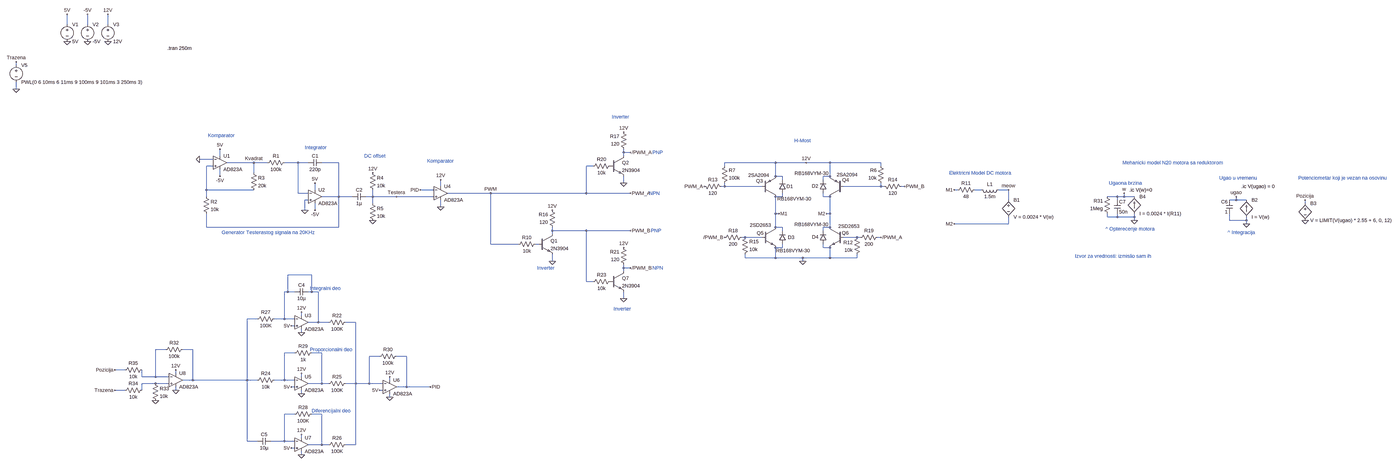
[diagram p0: schematic OP-AMP-OSC-Logicki.asc, whole sheet]
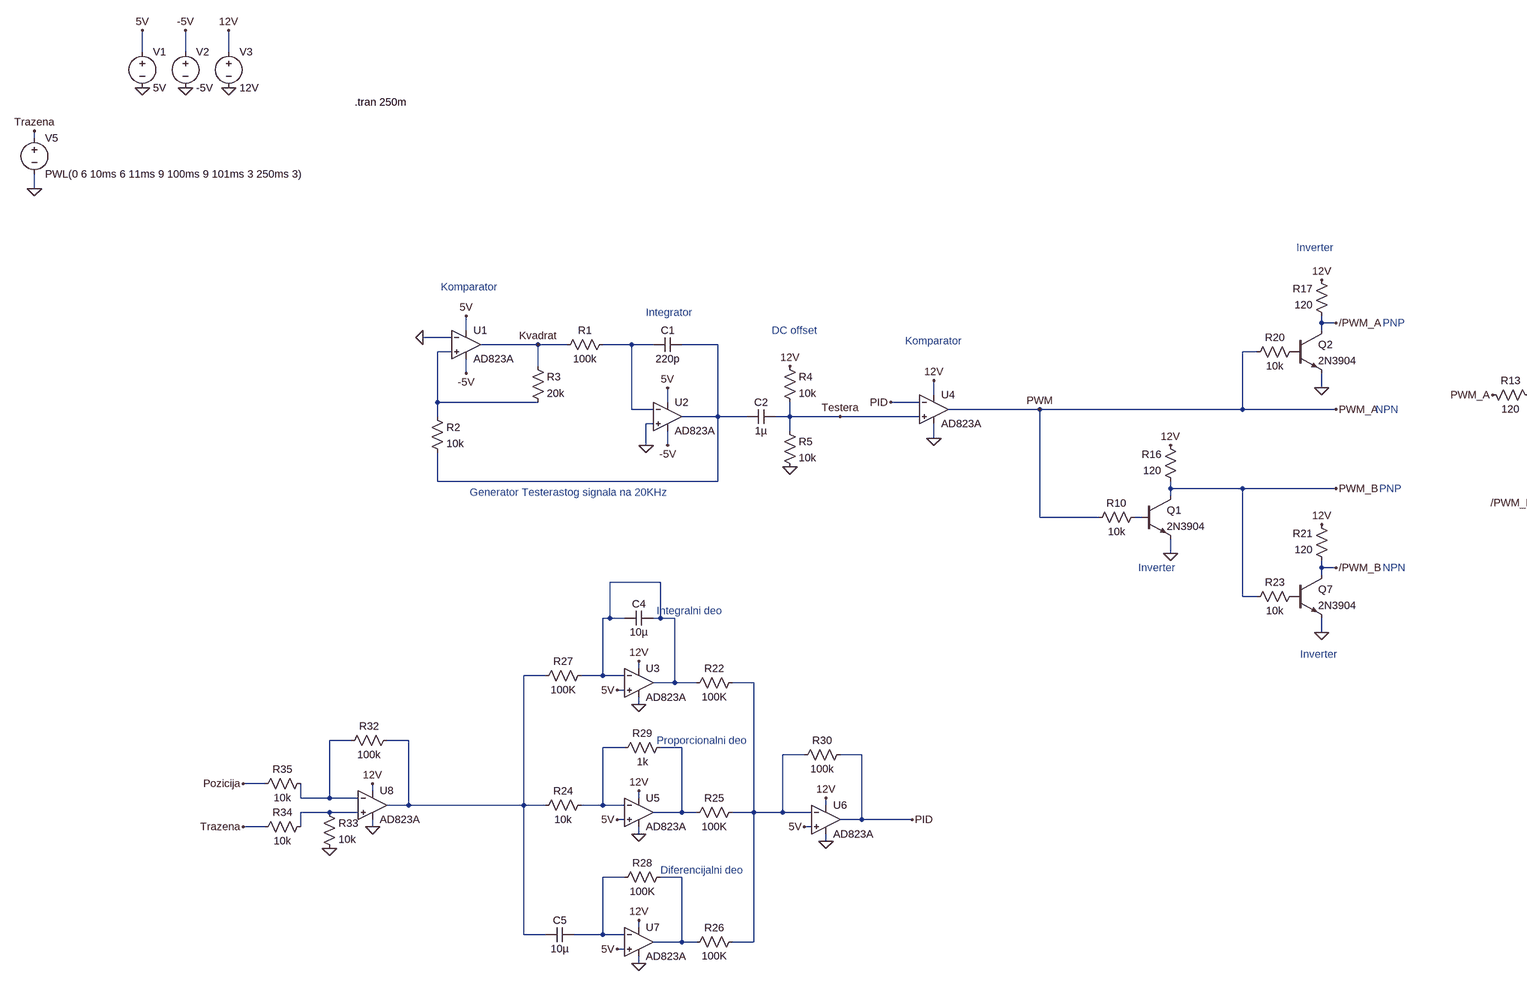
[diagram p1: schematic OP-AMP-OSC-Logicki.asc, part, row 1 of 1, column 1 of 2]
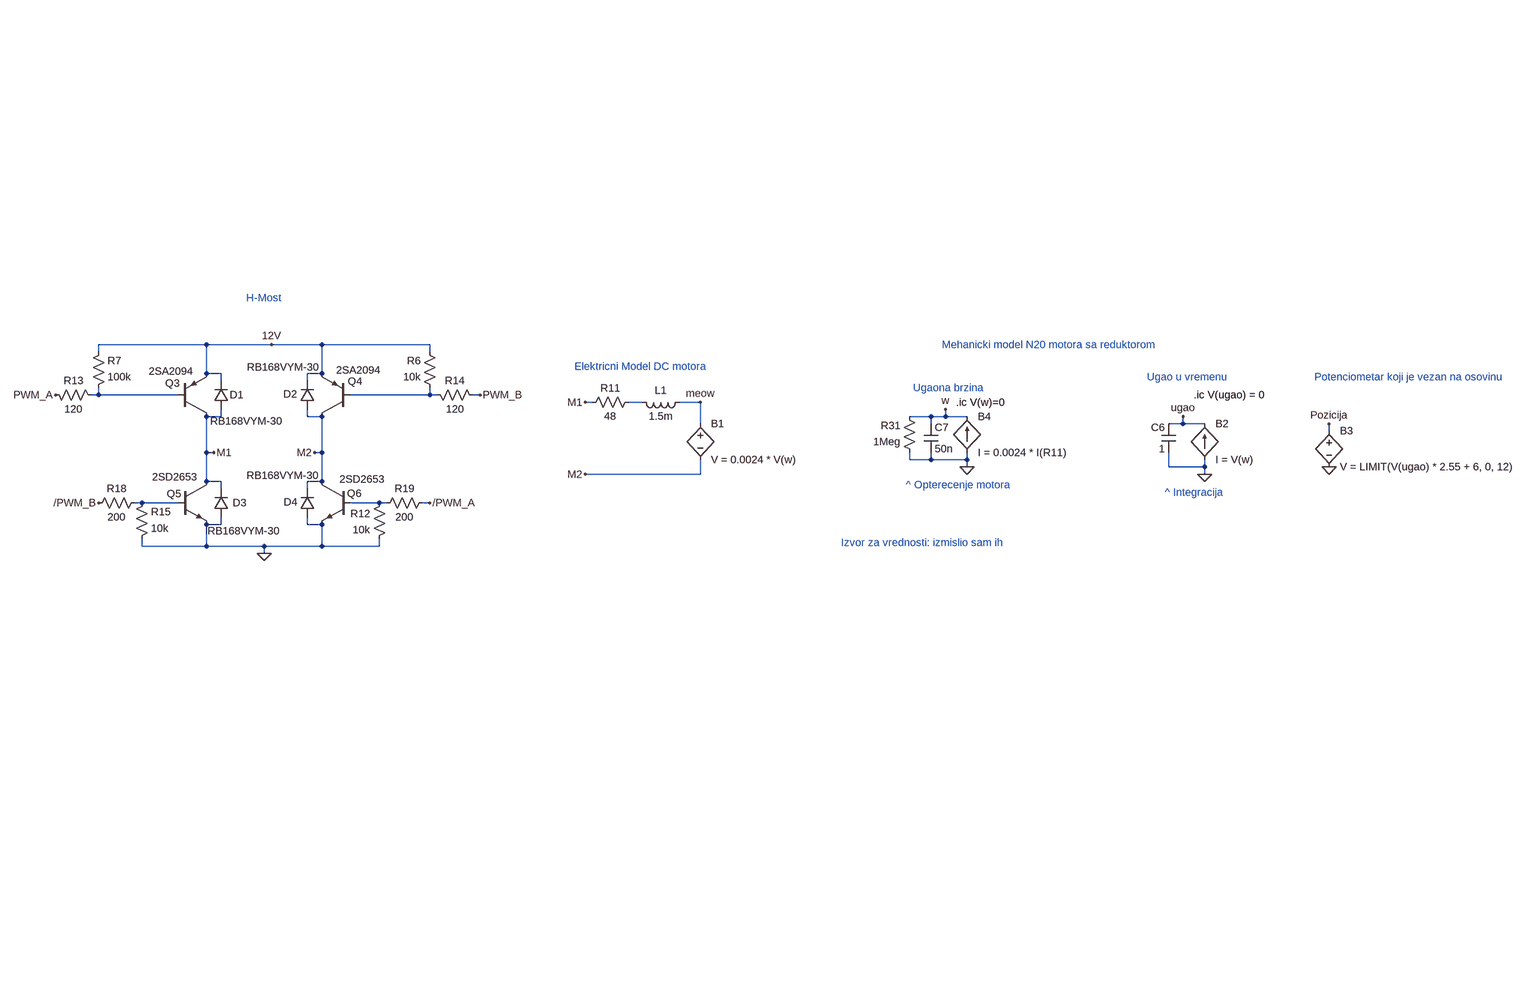
[diagram p2: schematic OP-AMP-OSC-Logicki.asc, part, row 1 of 1, column 2 of 2]
OP-AMP-OSC-Logicki.asc, the LTspice schematic file:
Version 4
SHEET 1 6380 2180
WIRE -1152 -816 -1152 -864
WIRE -1056 -816 -1056 -864
WIRE -960 -816 -960 -864
WIRE -1392 -624 -1392 -640
WIRE -1392 -512 -1392 -544
WIRE 1632 -208 1632 -224
WIRE 1664 -208 1632 -208
WIRE -432 -192 -432 -224
WIRE 1632 -192 1632 -208
WIRE -464 -176 -528 -176
WIRE -272 -160 -400 -160
WIRE -208 -160 -272 -160
WIRE -64 -160 -128 -160
WIRE -16 -160 -64 -160
WIRE 128 -160 48 -160
WIRE 2848 -160 2608 -160
WIRE 2992 -160 2848 -160
WIRE 3104 -160 2992 -160
WIRE 3344 -160 3104 -160
WIRE -464 -144 -496 -144
WIRE 1488 -144 1456 -144
WIRE 2608 -144 2608 -160
WIRE 3344 -144 3344 -160
WIRE -272 -112 -272 -160
WIRE -432 -96 -432 -128
WIRE 2848 -96 2848 -160
WIRE 2880 -96 2848 -96
WIRE 3104 -96 3104 -160
WIRE 3104 -96 3072 -96
WIRE 2880 -80 2880 -96
WIRE 3072 -80 3072 -96
WIRE 1632 -64 1632 -96
WIRE 608 -48 608 -80
WIRE 2608 -48 2608 -64
WIRE 2608 -48 2592 -48
WIRE 2784 -48 2608 -48
WIRE 3344 -48 3344 -64
WIRE 3344 -48 3168 -48
WIRE 3360 -48 3344 -48
WIRE 3456 -48 3440 -48
WIRE -496 -32 -496 -144
WIRE -272 -32 -496 -32
WIRE 16 -32 16 -64
WIRE 576 -32 512 -32
WIRE 4224 -32 4208 -32
WIRE 4336 -32 4304 -32
WIRE 4464 -32 4416 -32
WIRE -64 -16 -64 -160
WIRE -16 -16 -64 -16
WIRE 880 -16 640 -16
WIRE 1456 -16 1456 -144
WIRE 1456 -16 880 -16
WIRE 1664 -16 1456 -16
WIRE -496 0 -496 -32
WIRE 128 0 128 -160
WIRE 128 0 48 0
WIRE 192 0 128 0
WIRE 288 0 288 -32
WIRE 288 0 256 0
WIRE 400 0 288 0
WIRE 576 0 400 0
WIRE 2880 0 2880 -16
WIRE 2880 0 2848 0
WIRE 3072 0 3072 -16
WIRE 3104 0 3072 0
WIRE 4992 0 4944 0
WIRE 5024 0 5024 -16
WIRE 5024 0 4992 0
WIRE 5072 0 5024 0
WIRE -16 16 -32 16
WIRE 4464 16 4464 -32
WIRE 4992 16 4992 0
WIRE 5552 16 5552 0
WIRE 5552 16 5520 16
WIRE 5600 16 5552 16
WIRE 288 32 288 0
WIRE 5920 32 5920 16
WIRE 608 48 608 16
WIRE -32 64 -32 16
WIRE 16 64 16 32
WIRE 2848 80 2848 0
WIRE 2864 80 2848 80
WIRE 3104 80 3104 0
WIRE 3104 80 3088 80
WIRE 4944 96 4944 80
WIRE 4992 96 4992 80
WIRE 4992 96 4944 96
WIRE 5072 96 5072 80
WIRE 5072 96 4992 96
WIRE 5072 112 5072 96
WIRE 5520 112 5520 80
WIRE 5600 112 5600 96
WIRE 5600 112 5520 112
WIRE 4464 128 4464 96
WIRE 4464 128 4208 128
WIRE 5600 128 5600 112
WIRE -496 144 -496 80
WIRE 128 144 128 0
WIRE 128 144 -496 144
WIRE 2848 144 2848 80
WIRE 2880 144 2848 144
WIRE 3104 144 3104 80
WIRE 3104 144 3072 144
WIRE 1296 160 1296 144
WIRE 1456 160 1296 160
WIRE 1664 160 1456 160
WIRE 2880 160 2880 144
WIRE 3072 160 3072 144
WIRE 1296 176 1296 160
WIRE 2704 192 2688 192
WIRE 2784 192 2704 192
WIRE 3232 192 3168 192
WIRE 3248 192 3232 192
WIRE 3344 192 3328 192
WIRE 880 224 880 -16
WIRE 1136 224 880 224
WIRE 1232 224 1216 224
WIRE 2880 240 2880 224
WIRE 2880 240 2848 240
WIRE 3072 240 3072 224
WIRE 3104 240 3072 240
WIRE 2704 288 2704 272
WIRE 2848 288 2848 240
WIRE 2848 288 2704 288
WIRE 2976 288 2848 288
WIRE 3104 288 3104 240
WIRE 3104 288 2976 288
WIRE 3232 288 3232 272
WIRE 3232 288 3104 288
WIRE 1296 304 1296 272
WIRE 2976 304 2976 288
WIRE 1632 336 1632 320
WIRE 1664 336 1632 336
WIRE 1632 352 1632 336
WIRE 0 368 -112 368
WIRE 1456 400 1456 160
WIRE 1488 400 1456 400
WIRE -112 448 -112 368
WIRE -112 448 -128 448
WIRE -80 448 -112 448
WIRE 0 448 0 368
WIRE 0 448 -16 448
WIRE 32 448 0 448
WIRE 1632 480 1632 448
WIRE -48 560 -48 544
WIRE -256 576 -304 576
WIRE -128 576 -128 448
WIRE -128 576 -176 576
WIRE -80 576 -128 576
WIRE 32 592 32 448
WIRE 32 592 -16 592
WIRE 80 592 32 592
WIRE 208 592 160 592
WIRE -80 608 -96 608
WIRE -48 640 -48 624
WIRE -688 720 -736 720
WIRE -560 720 -608 720
WIRE -80 736 -128 736
WIRE 48 736 0 736
WIRE 320 752 272 752
WIRE 448 752 400 752
WIRE -880 816 -928 816
WIRE -640 832 -640 816
WIRE -800 848 -800 816
WIRE -736 848 -736 720
WIRE -736 848 -800 848
WIRE -672 848 -736 848
WIRE -48 848 -48 832
WIRE -560 864 -560 720
WIRE -560 864 -608 864
WIRE -304 864 -304 576
WIRE -304 864 -560 864
WIRE -256 864 -304 864
WIRE -128 864 -128 736
WIRE -128 864 -176 864
WIRE -80 864 -128 864
WIRE 368 864 368 848
WIRE -736 880 -800 880
WIRE -672 880 -736 880
WIRE 48 880 48 736
WIRE 48 880 -16 880
WIRE 80 880 48 880
WIRE 208 880 208 592
WIRE 208 880 160 880
WIRE 272 880 272 752
WIRE 272 880 208 880
WIRE 336 880 272 880
WIRE -80 896 -96 896
WIRE 448 896 448 752
WIRE 448 896 400 896
WIRE 560 896 448 896
WIRE -880 912 -928 912
WIRE -800 912 -800 880
WIRE -640 912 -640 896
WIRE 336 912 320 912
WIRE -48 928 -48 912
WIRE 368 944 368 928
WIRE -80 1024 -128 1024
WIRE 48 1024 0 1024
WIRE -48 1136 -48 1120
WIRE -304 1152 -304 864
WIRE -256 1152 -304 1152
WIRE -128 1152 -128 1024
WIRE -128 1152 -192 1152
WIRE -80 1152 -128 1152
WIRE 48 1168 48 1024
WIRE 48 1168 -16 1168
WIRE 80 1168 48 1168
WIRE 208 1168 208 880
WIRE 208 1168 160 1168
WIRE -80 1184 -96 1184
WIRE -48 1216 -48 1200
FLAG -1152 -736 0
FLAG -1152 -864 5V
FLAG -1056 -736 0
FLAG -1056 -864 -5V
FLAG -960 -736 0
FLAG -960 -864 12V
FLAG -32 64 0
FLAG -528 -176 0
FLAG -432 -96 -5V
FLAG -432 -224 5V
FLAG 16 -64 5V
FLAG 608 48 0
FLAG 608 -80 12V
FLAG 512 -32 PID
FLAG 288 112 0
FLAG 288 -112 12V
FLAG 400 0 Testera
FLAG 560 896 PID
FLAG 2976 304 0
FLAG 2992 -160 12V
FLAG 2864 80 M1
FLAG 3088 80 M2
FLAG 2512 -48 PWM_A
FLAG 4208 128 M2
FLAG 4208 -32 M1
FLAG 2608 192 /PWM_B
FLAG 1664 -16 PWM_A
FLAG -272 -160 Kvadrat
FLAG 1296 304 0
FLAG 1296 64 12V
FLAG 3456 -48 PWM_B
FLAG 3344 192 /PWM_A
FLAG 1664 160 PWM_B
FLAG 1632 -64 0
FLAG 1632 -304 12V
FLAG 1664 -208 /PWM_A
FLAG 1632 480 0
FLAG 1632 240 12V
FLAG 1664 336 /PWM_B
FLAG 880 -16 PWM
FLAG 16 64 -5V
FLAG -48 640 0
FLAG -48 544 12V
FLAG -48 928 0
FLAG -48 1216 0
FLAG -48 1120 12V
FLAG -48 832 12V
FLAG 368 944 0
FLAG 368 848 12V
FLAG 320 912 5V
FLAG -96 1184 5V
FLAG -96 896 5V
FLAG -96 608 5V
FLAG 4464 -32 meow
FLAG 5072 112 0
FLAG 5024 -16 w
FLAG 5600 128 0
FLAG 5552 0 ugao
FLAG 5920 112 0
FLAG 5920 16 Pozicija
FLAG -1392 -512 0
FLAG -1392 -640 Trazena
FLAG -640 912 0
FLAG -640 816 12V
FLAG -928 912 Trazena
FLAG -928 816 Pozicija
FLAG -736 960 0
SYMBOL voltage -1152 -832 R0
WINDOW 123 0 0 Left 0
WINDOW 39 0 0 Left 0
SYMATTR InstName V1
SYMATTR Value 5V
SYMBOL voltage -1056 -832 R0
WINDOW 123 0 0 Left 0
WINDOW 39 0 0 Left 0
SYMATTR InstName V2
SYMATTR Value -5V
SYMBOL voltage -960 -832 R0
WINDOW 123 0 0 Left 0
WINDOW 39 0 0 Left 0
SYMATTR InstName V3
SYMATTR Value 12V
SYMBOL OpAmps\\AD823A -432 -224 R0
SYMATTR InstName U1
SYMBOL OpAmps\\AD823A 16 -64 R0
SYMATTR InstName U2
SYMBOL res -112 -176 R90
WINDOW 0 0 56 VBottom 2
WINDOW 3 32 56 VTop 2
SYMATTR InstName R1
SYMATTR Value 100k
SYMBOL cap 48 -176 R90
WINDOW 0 0 32 VBottom 2
WINDOW 3 32 32 VTop 2
SYMATTR InstName C1
SYMATTR Value 220p
SYMBOL res -512 -16 R0
SYMATTR InstName R2
SYMATTR Value 10k
SYMBOL res -288 -128 R0
SYMATTR InstName R3
SYMATTR Value 20k
SYMBOL OpAmps\\AD823A 608 -80 R0
SYMATTR InstName U4
SYMBOL cap 256 -16 R90
WINDOW 0 0 32 VBottom 2
WINDOW 3 32 32 VTop 2
SYMATTR InstName C2
SYMATTR Value 1µ
SYMBOL res 272 -128 R0
SYMATTR InstName R4
SYMATTR Value 10k
SYMBOL res 272 16 R0
SYMATTR InstName R5
SYMATTR Value 10k
SYMBOL pnp 2784 0 M180
WINDOW 0 -28 74 Left 2
WINDOW 3 -65 101 Left 2
SYMATTR InstName Q3
SYMATTR Value 2SA2094
SYMBOL pnp 3168 0 R180
WINDOW 0 -26 78 Left 2
WINDOW 3 -67 103 Left 2
SYMATTR InstName Q4
SYMATTR Value 2SA2094
SYMBOL npn 2784 144 R0
WINDOW 0 -25 28 Left 2
WINDOW 3 -57 -10 Left 2
SYMATTR InstName Q5
SYMATTR Value 2SD2653
SYMBOL npn 3168 144 M0
WINDOW 0 -24 27 Left 2
WINDOW 3 -76 -5 Left 2
SYMATTR InstName Q6
SYMATTR Value 2SD2653
SYMBOL res 4320 -48 R90
WINDOW 0 0 56 VBottom 2
WINDOW 3 32 56 VTop 2
SYMATTR InstName R11
SYMATTR Value 48
SYMBOL res 3248 176 M0
SYMATTR InstName R12
SYMATTR Value 10k
SYMBOL res 2688 288 M180
WINDOW 0 36 76 Left 2
WINDOW 3 36 40 Left 2
SYMATTR InstName R15
SYMATTR Value 10k
SYMBOL res 3360 -48 R180
WINDOW 0 36 76 Left 2
WINDOW 3 36 40 Left 2
SYMATTR InstName R6
SYMATTR Value 10k
SYMBOL res 2592 -48 M180
WINDOW 0 36 76 Left 2
WINDOW 3 36 40 Left 2
SYMATTR InstName R7
SYMATTR Value 100k
SYMBOL res 2496 -64 M90
WINDOW 0 0 56 VBottom 2
WINDOW 3 32 56 VTop 2
SYMATTR InstName R13
SYMATTR Value 120
SYMBOL res 3344 -64 M90
WINDOW 0 0 56 VBottom 2
WINDOW 3 32 56 VTop 2
SYMATTR InstName R14
SYMATTR Value 120
SYMBOL res 2704 176 R90
WINDOW 0 0 56 VBottom 2
WINDOW 3 32 56 VTop 2
SYMATTR InstName R18
SYMATTR Value 200
SYMBOL res 3344 176 R90
WINDOW 0 0 56 VBottom 2
WINDOW 3 32 56 VTop 2
SYMATTR InstName R19
SYMATTR Value 200
SYMBOL npn 1232 176 R0
SYMATTR InstName Q1
SYMATTR Value 2N3904
SYMBOL res 1232 208 R90
WINDOW 0 0 56 VBottom 2
WINDOW 3 32 56 VTop 2
SYMATTR InstName R10
SYMATTR Value 10k
SYMBOL res 1312 160 R180
WINDOW 0 36 76 Left 2
WINDOW 3 36 40 Left 2
SYMATTR InstName R16
SYMATTR Value 120
SYMBOL npn 1568 -192 R0
SYMATTR InstName Q2
SYMATTR Value 2N3904
SYMBOL res 1648 -208 R180
WINDOW 0 36 76 Left 2
WINDOW 3 36 40 Left 2
SYMATTR InstName R17
SYMATTR Value 120
SYMBOL res 1584 -160 R90
WINDOW 0 0 56 VBottom 2
WINDOW 3 32 56 VTop 2
SYMATTR InstName R20
SYMATTR Value 10k
SYMBOL npn 1568 352 R0
SYMATTR InstName Q7
SYMATTR Value 2N3904
SYMBOL res 1648 336 R180
WINDOW 0 36 76 Left 2
WINDOW 3 36 40 Left 2
SYMATTR InstName R21
SYMATTR Value 120
SYMBOL res 1584 384 R90
WINDOW 0 0 56 VBottom 2
WINDOW 3 32 56 VTop 2
SYMATTR InstName R23
SYMATTR Value 10k
SYMBOL ind 4432 -48 R90
WINDOW 0 5 56 VBottom 2
WINDOW 3 32 56 VTop 2
SYMATTR InstName L1
SYMATTR Value 1.5m
SYMATTR SpiceLine Rser=1m
SYMBOL diode 2864 -16 M180
WINDOW 0 35 32 Left 2
WINDOW 3 -8 -26 Left 2
SYMATTR InstName D1
SYMATTR Value RB168VYM-30
SYMBOL diode 3088 -16 R180
WINDOW 0 39 34 Left 2
WINDOW 3 -10 94 Left 2
SYMATTR InstName D2
SYMATTR Value RB168VYM-30
SYMBOL diode 2864 224 M180
WINDOW 0 42 32 Left 2
WINDOW 3 -14 -30 Left 2
SYMATTR InstName D3
SYMATTR Value RB168VYM-30
SYMBOL diode 3088 224 R180
WINDOW 0 38 34 Left 2
WINDOW 3 -9 93 Left 2
SYMATTR InstName D4
SYMATTR Value RB168VYM-30
SYMBOL OpAmps\\AD823A -48 528 R0
SYMATTR InstName U3
SYMBOL res 176 576 R90
WINDOW 0 0 56 VBottom 2
WINDOW 3 32 56 VTop 2
SYMATTR InstName R22
SYMATTR Value 100K
SYMBOL OpAmps\\AD823A -48 816 R0
SYMATTR InstName U5
SYMBOL res 176 864 R90
WINDOW 0 0 56 VBottom 2
WINDOW 3 32 56 VTop 2
SYMATTR InstName R25
SYMATTR Value 100K
SYMBOL OpAmps\\AD823A -48 1104 R0
SYMATTR InstName U7
SYMBOL res 176 1152 R90
WINDOW 0 0 56 VBottom 2
WINDOW 3 32 56 VTop 2
SYMATTR InstName R26
SYMATTR Value 100K
SYMBOL OpAmps\\AD823A 368 832 R0
SYMATTR InstName U6
SYMBOL res -160 560 R90
WINDOW 0 0 56 VBottom 2
WINDOW 3 32 56 VTop 2
SYMATTR InstName R27
SYMATTR Value 100K
SYMBOL res -160 848 R90
WINDOW 0 0 56 VBottom 2
WINDOW 3 32 56 VTop 2
SYMATTR InstName R24
SYMATTR Value 10k
SYMBOL res 16 1008 R90
WINDOW 0 0 56 VBottom 2
WINDOW 3 32 56 VTop 2
SYMATTR InstName R28
SYMATTR Value 100K
SYMBOL cap -16 432 R90
WINDOW 0 0 32 VBottom 2
WINDOW 3 32 32 VTop 2
SYMATTR InstName C4
SYMATTR Value 10µ
SYMBOL cap -192 1136 R90
WINDOW 0 0 32 VBottom 2
WINDOW 3 32 32 VTop 2
SYMATTR InstName C5
SYMATTR Value 10µ
SYMBOL res 16 720 R90
WINDOW 0 0 56 VBottom 2
WINDOW 3 32 56 VTop 2
SYMATTR InstName R29
SYMATTR Value 1k
SYMBOL res 416 736 R90
WINDOW 0 0 56 VBottom 2
WINDOW 3 32 56 VTop 2
SYMATTR InstName R30
SYMATTR Value 100k
SYMBOL bv 4464 0 R0
SYMATTR InstName B1
SYMATTR Value V = 0.0024 * V(w)
SYMBOL bi 5072 80 M180
WINDOW 0 24 80 Left 2
WINDOW 3 24 0 Left 2
SYMATTR InstName B4
SYMATTR Value I = 0.0024 * I(R11)
SYMBOL bi 5600 96 M180
WINDOW 0 24 80 Left 2
WINDOW 3 24 0 Left 2
SYMATTR InstName B2
SYMATTR Value I = V(w)
SYMBOL cap 5536 16 M0
SYMATTR InstName C6
SYMATTR Value 1
SYMBOL cap 4976 16 R0
SYMATTR InstName C7
SYMATTR Value 50n
SYMBOL res 4960 96 R180
WINDOW 0 36 76 Left 2
WINDOW 3 36 40 Left 2
SYMATTR InstName R31
SYMATTR Value 1Meg
SYMBOL bv 5920 16 R0
SYMATTR InstName B3
SYMATTR Value V = LIMIT(V(ugao) * 2.55 + 6, 0, 12)
SYMBOL voltage -1392 -640 R0
WINDOW 123 0 0 Left 0
WINDOW 39 0 0 Left 0
SYMATTR InstName V5
SYMATTR Value PWL(0 6 10ms 6 11ms 9 100ms 9 101ms 3 250ms 3)
SYMBOL OpAmps\\AD823A -640 800 R0
SYMATTR InstName U8
SYMBOL res -592 704 R90
WINDOW 0 0 56 VBottom 2
WINDOW 3 32 56 VTop 2
SYMATTR InstName R32
SYMATTR Value 100k
SYMBOL res -752 864 R0
SYMATTR InstName R33
SYMATTR Value 10k
SYMBOL res -784 896 R90
WINDOW 0 0 56 VBottom 2
WINDOW 3 32 56 VTop 2
SYMATTR InstName R34
SYMATTR Value 10k
SYMBOL res -784 800 R90
WINDOW 0 0 56 VBottom 2
WINDOW 3 32 56 VTop 2
SYMATTR InstName R35
SYMATTR Value 10k
TEXT -680 -704 Left 2 !.tran 250m
TEXT -424 168 Left 2 ;Generator Testerastog signala na 20KHz
TEXT 544 -168 Left 2 ;Komparator
TEXT 248 -192 Left 2 ;DC offset
TEXT -32 -232 Left 2 ;Integrator
TEXT -488 -288 Left 2 ;Komparator
TEXT 2936 -264 Left 2 ;H-Most
TEXT 1576 -376 Left 2 ;Inverter
TEXT 1584 528 Left 2 ;Inverter
TEXT 1224 336 Left 2 ;Inverter
TEXT 1760 160 Left 2 ;PNP
TEXT 1768 336 Left 2 ;NPN
TEXT 1768 -208 Left 2 ;PNP
TEXT 1752 -16 Left 2 ;NPN
TEXT -8 432 Left 2 ;Integralni deo
TEXT -8 720 Left 2 ;Proporcionalni deo
TEXT 0 1008 Left 2 ;Diferencijalni deo
TEXT 4184 -112 Left 2 ;Elektricni Model DC motora
TEXT 5576 -48 Left 2 !.ic V(ugao) = 0
TEXT 4952 -64 Left 2 ;Ugaona brzina
TEXT 4936 152 Left 2 ;^ Opterecenje motora
TEXT 5472 -88 Left 2 ;Ugao u vremenu
TEXT 5512 168 Left 2 ;^ Integracija
TEXT 5048 -32 Left 2 !.ic V(w)=0
TEXT 5016 -160 Left 2 ;Mehanicki model N20 motora sa reduktorom
TEXT 4792 280 Left 2 ;Izvor za vrednosti: izmislio sam ih
TEXT 5888 -88 Left 2 ;Potenciometar koji je vezan na osovinu

The netlist it stands for:
* OP-AMP-OSC-Logicki.asc
V1 5V 0 5V
V2 -5V 0 -5V
V3 12V 0 12V
XU1 N003 0 5V -5V Kvadrat AD823A  ; pins In+ In- V+ V- OUT
XU2 0 N001 5V -5V N002 AD823A  ; pins In+ In- V+ V- OUT
R1 N001 Kvadrat 100k
C1 N002 N001 220p
R2 N003 N002 10k
R3 Kvadrat N003 20k
XU4 Testera PID 12V 0 PWM AD823A  ; pins In+ In- V+ V- OUT
C2 Testera N002 1µ
R4 12V Testera 10k
R5 Testera 0 10k
Q3 M1 N004 12V 0 2SA2094
Q4 M2 N005 12V 0 2SA2094
Q5 M1 N007 0 0 2SD2653
Q6 M2 N008 0 0 2SD2653
R11 N006 M1 48
R12 N008 0 10k
R15 0 N007 10k
R6 N005 12V 10k
R7 N004 12V 100k
R13 PWM N004 120
R14 N005 PWM_B 120
R18 N007 /PWM_B 200
R19 /PWM_A N008 200
Q1 PWM_B N009 0 0 2N3904
R10 N009 PWM 10k
R16 PWM_B 12V 120
Q2 /PWM_A P001 0 0 2N3904
R17 /PWM_A 12V 120
R20 P001 PWM 10k
Q7 /PWM_B P002 0 0 2N3904
R21 /PWM_B 12V 120
R23 P002 PWM_B 10k
L1 meow N006 1.5m Rser=1m
D1 M1 12V RB168VYM-30
D2 M2 12V RB168VYM-30
D3 0 M1 RB168VYM-30
D4 0 M2 RB168VYM-30
XU3 5V N010 12V 0 N010 AD823A  ; pins In+ In- V+ V- OUT
R22 N012 N010 100K
XU5 5V N014 12V 0 N015 AD823A  ; pins In+ In- V+ V- OUT
R25 N012 N015 100K
XU7 5V N017 12V 0 N018 AD823A  ; pins In+ In- V+ V- OUT
R26 N012 N018 100K
XU6 5V N012 12V 0 PID AD823A  ; pins In+ In- V+ V- OUT
R27 N010 N011 100K
R24 N014 N011 10k
R28 N018 N017 100K
C4 N010 N010 10µ
C5 N017 N011 10µ
R29 N015 N014 1k
R30 PID N012 100k
B1 meow M2 V = 0.0024 * V(w)
B4 0 w I = 0.0024 * I(R11)
B2 0 ugao I = V(w)
C6 ugao 0 1
C7 w 0 50n
R31 0 w 1Meg
B3 Pozicija 0 V = LIMIT(V(ugao) * 2.55 + 6, 0, 12)
V5 Trazena 0 PWL(0 6 10ms 6 11ms 9 100ms 9 101ms 3 250ms 3)
XU8 N016 N013 12V 0 N011 AD823A  ; pins In+ In- V+ V- OUT
R32 N011 N013 100k
R33 N016 0 10k
R34 N016 Trazena 10k
R35 N013 Pozicija 10k
.model D D
.lib standard.dio
.model NPN NPN
.model PNP PNP
.lib standard.bjt
.tran 250m
* Generator Testerastog signala na 20KHz
* Komparator
* DC offset
* Integrator
* Komparator
* H-Most
* Inverter
* Inverter
* Inverter
* PNP
* NPN
* PNP
* NPN
* Integralni deo
* Proporcionalni deo
* Diferencijalni deo
* Elektricni Model DC motora
.ic V(ugao) = 0
* Ugaona brzina
* ^ Opterecenje motora
* Ugao u vremenu
* ^ Integracija
.ic V(w)=0
* Mehanicki model N20 motora sa reduktorom
* Izvor za vrednosti: izmislio sam ih
* Potenciometar koji je vezan na osovinu
.backanno
.end